# Altium project cua.PrjPcb
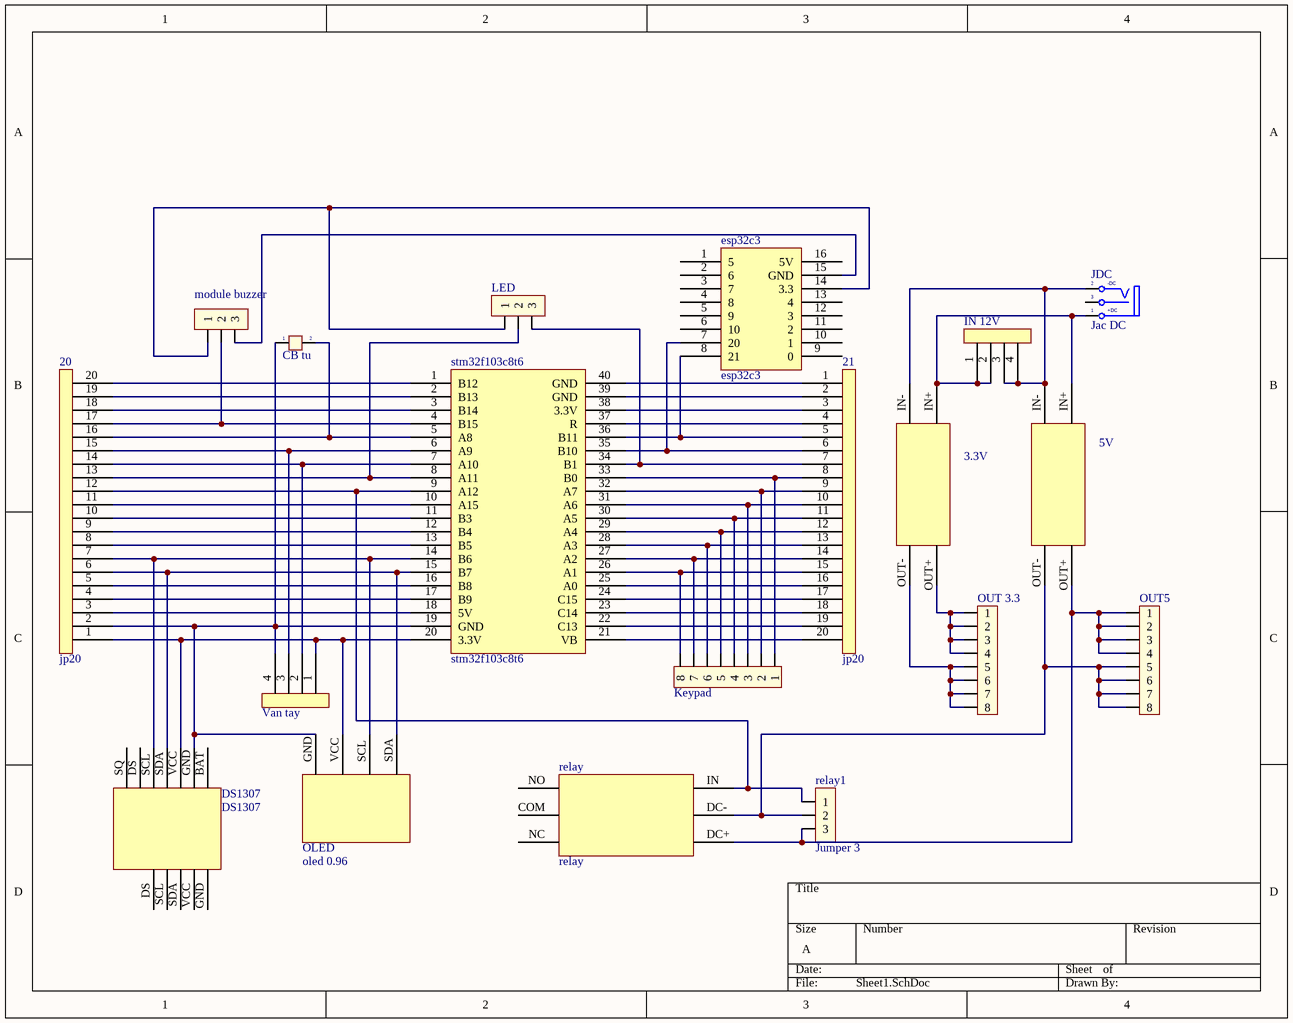
[diagram p0: Sheet1.SchDoc]
1 sheet, 19 parts. Net scope: global (net labels, ports and power ports of the same name join across sheets).
Board file: PCB1.PcbDoc

## Sheet Sheet1.SchDoc
size A; SheetNumber: 1; SheetTotal: 1

### Parts
3.3V  lm2596  [lm2596]  (value not drawn)
5V  lm2596  [lm2596]  (value not drawn)
20  jp20  [jp20]
21  jp20  [jp20]
CB_tu  Jumper 2  [JP2]  (value not drawn)
DS1307  DS1307  [DS1307]
esp32c3  esp32c3  [esp32c3]
IN_12V  jp4  [jp4]  (value not drawn)
JDC  Jac DC  [DC-IN]
Keypad  JP8 PIN  [JP8]  (value not drawn)
LED  Jumper 3  [JP3]  (value not drawn)
module_buzzer  Jumper 3  [JP3]  (value not drawn)
OLED  oled 0.96  [oled 0.96]
OUT5  JP8 PIN  [JP8]  (value not drawn)
OUT_3.3  JP8 PIN  [JP8]  (value not drawn)
relay  relay  [relay]
relay1  Jumper 3  [JP3]
stm32f103c8t6  stm32f103c8t6  [stm32f103c8t6]
Van_tay  jp4  [jp4]  (value not drawn)

### Nets
Net3.3V_IN+: 3.3V.IN+ 5V.IN+ IN_12V.1 IN_12V.2 JDC.1(T)
Net3.3V_IN-: 3.3V.IN- 5V.IN- IN_12V.3 IN_12V.4 JDC.2(TN)
Net3.3V_OUT+: 3.3V.OUT+ OUT_3.3.1 OUT_3.3.2 OUT_3.3.3 OUT_3.3.4
Net3.3V_OUT-: 3.3V.OUT- OUT_3.3.5 OUT_3.3.6 OUT_3.3.7 OUT_3.3.8
Net5V_OUT+: 5V.OUT+ OUT5.1 OUT5.2 OUT5.3 OUT5.4 relay.DC+ relay1.3
Net5V_OUT-: 5V.OUT- OUT5.5 OUT5.6 OUT5.7 OUT5.8 relay.DC- relay1.2
Net20_1: 20.1 DS1307.VCC OLED.VCC stm32f103c8t6.20(3.3V) Van_tay.1
Net20_2: 20.2 CB_tu.1 DS1307.GND OLED.GND stm32f103c8t6.19(GND) Van_tay.4
Net20_3: 20.3 stm32f103c8t6.18(5V)
Net20_4: 20.4 stm32f103c8t6.17(B9)
Net20_5: 20.5 stm32f103c8t6.16(B8)
Net20_6: 20.6 DS1307.SDA OLED.SDA stm32f103c8t6.15(B7)
Net20_7: 20.7 DS1307.SCL OLED.SCL stm32f103c8t6.14(B6)
Net20_8: 20.8 stm32f103c8t6.13(B5)
Net20_9: 20.9 stm32f103c8t6.12(B4)
Net20_10: 20.10 stm32f103c8t6.11(B3)
Net20_11: 20.11 stm32f103c8t6.10(A15)
Net20_12: 20.12 relay.IN relay1.1 stm32f103c8t6.9(A12)
Net20_13: 20.13 LED.2 stm32f103c8t6.8(A11)
Net20_14: 20.14 stm32f103c8t6.7(A10) Van_tay.2
Net20_15: 20.15 stm32f103c8t6.6(A9) Van_tay.3
Net20_16: 20.16 CB_tu.2 stm32f103c8t6.5(A8)
Net20_17: 20.17 module_buzzer.2 stm32f103c8t6.4(B15)
Net20_18: 20.18 stm32f103c8t6.3(B14)
Net20_19: 20.19 stm32f103c8t6.2(B13)
Net20_20: 20.20 stm32f103c8t6.1(B12)
Net21_1: 21.1 stm32f103c8t6.40(GND)
Net21_2: 21.2 stm32f103c8t6.39(GND)
Net21_3: 21.3 stm32f103c8t6.38(3.3V)
Net21_4: 21.4 stm32f103c8t6.37(R)
Net21_5: 21.5 esp32c3.8(21) stm32f103c8t6.36(B11)
Net21_6: 21.6 esp32c3.7(20) stm32f103c8t6.35(B10)
Net21_7: 21.7 LED.3 stm32f103c8t6.34(B1)
Net21_8: 21.8 Keypad.1 stm32f103c8t6.33(B0)
Net21_9: 21.9 Keypad.2 stm32f103c8t6.32(A7)
Net21_10: 21.10 Keypad.3 stm32f103c8t6.31(A6)
Net21_11: 21.11 Keypad.4 stm32f103c8t6.30(A5)
Net21_12: 21.12 Keypad.5 stm32f103c8t6.29(A4)
Net21_13: 21.13 Keypad.6 stm32f103c8t6.28(A3)
Net21_14: 21.14 Keypad.7 stm32f103c8t6.27(A2)
Net21_15: 21.15 Keypad.8 stm32f103c8t6.26(A1)
Net21_16: 21.16 stm32f103c8t6.25(A0)
Net21_17: 21.17 stm32f103c8t6.24(C15)
Net21_18: 21.18 stm32f103c8t6.23(C14)
Net21_19: 21.19 stm32f103c8t6.22(C13)
Net21_20: 21.20 stm32f103c8t6.21(VB)
Netesp32c3_14: esp32c3.14(3.3) LED.1 module_buzzer.1
Netesp32c3_15: esp32c3.15(GND) module_buzzer.3

Not connected (* = marked no-connect by the designer): DS1307 BAT(9) DS(0) SQ(10); esp32c3 1(5) 2(6) 3(7) 4(8) 5(9) 6(10) 9(0) 10(1) 11(2) 12(3) 13(4) 16(5V); JDC 3(S); relay COM(17) NC(18) NO(16)

### Notes on the sheet
- (in symbol DCIN) -DC; +DC

### Library data of the parts
CB_tu = JP 2: Value: JP 2
JDC = DCIN: Jac DC input; Value: Jac DC
Keypad OUT5 OUT_3.3 = JP8: Value: JP7
LED module_buzzer relay1 = JP3: Value: J3